# Altium schematic sheet 04_SiP_GND_NC.SchDoc
size 508 x 381 mm; SheetNumber: 4; SheetTotal: 16
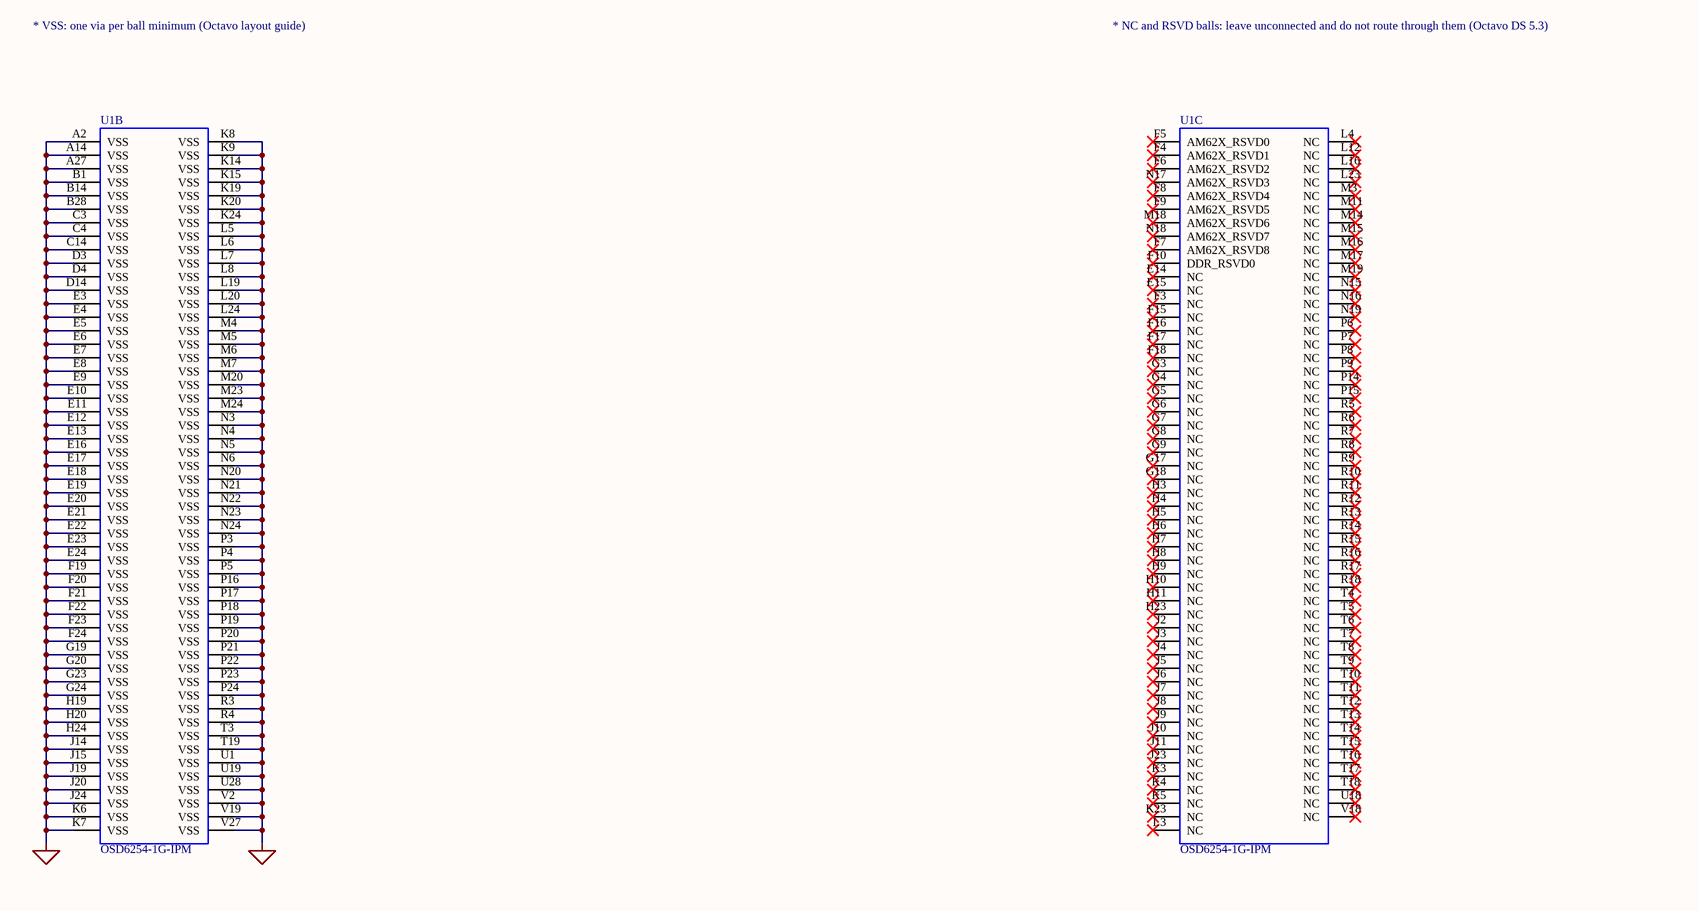
[diagram p0: 04_SiP_GND_NC.SchDoc]

## Parts
U1  OSD6254-1G-IPM  [OSD62X-PM_BGA500]  (parts B,C of 9)

## Nets
GND: U1.A2(VSS) U1.A14(VSS) U1.A27(VSS) U1.B1(VSS) U1.B14(VSS) U1.B28(VSS) U1.C3(VSS) U1.C4(VSS) U1.C14(VSS) U1.D3(VSS) U1.D4(VSS) U1.D14(VSS) U1.E3(VSS) U1.E4(VSS) U1.E5(VSS) U1.E6(VSS) U1.E7(VSS) U1.E8(VSS) U1.E9(VSS) U1.E10(VSS) U1.E11(VSS) U1.E12(VSS) U1.E13(VSS) U1.E16(VSS) U1.E17(VSS) U1.E18(VSS) U1.E19(VSS) U1.E20(VSS) U1.E21(VSS) U1.E22(VSS) U1.E23(VSS) U1.E24(VSS) U1.F19(VSS) U1.F20(VSS) U1.F21(VSS) U1.F22(VSS) U1.F23(VSS) U1.F24(VSS) U1.G19(VSS) U1.G20(VSS) U1.G23(VSS) U1.G24(VSS) U1.H19(VSS) U1.H20(VSS) U1.H24(VSS) U1.J14(VSS) U1.J15(VSS) U1.J19(VSS) U1.J20(VSS) U1.J24(VSS) U1.K6(VSS) U1.K7(VSS) U1.K8(VSS) U1.K9(VSS) U1.K14(VSS) U1.K15(VSS) U1.K19(VSS) U1.K20(VSS) U1.K24(VSS) U1.L5(VSS) U1.L6(VSS) U1.L7(VSS) U1.L8(VSS) U1.L19(VSS) U1.L20(VSS) U1.L24(VSS) U1.M4(VSS) U1.M5(VSS) U1.M6(VSS) U1.M7(VSS) U1.M20(VSS) U1.M23(VSS) U1.M24(VSS) U1.N3(VSS) U1.N4(VSS) U1.N5(VSS) U1.N6(VSS) U1.N20(VSS) U1.N21(VSS) U1.N22(VSS) U1.N23(VSS) U1.N24(VSS) U1.P3(VSS) U1.P4(VSS) U1.P5(VSS) U1.P16(VSS) U1.P17(VSS) U1.P18(VSS) U1.P19(VSS) U1.P20(VSS) U1.P21(VSS) U1.P22(VSS) U1.P23(VSS) U1.P24(VSS) U1.R3(VSS) U1.R4(VSS) U1.T3(VSS) U1.T19(VSS) U1.U1(VSS) U1.U19(VSS) U1.U28(VSS) U1.V2(VSS) U1.V19(VSS) U1.V27(VSS)

Not connected (* = marked no-connect by the designer): U1 E14(NC)* E15(NC)* F3(NC)* F4(AM62X_RSVD1)* F5(AM62X_RSVD0)* F6(AM62X_RSVD2)* F7(AM62X_RSVD8)* F8(AM62X_RSVD4)* F9(AM62X_RSVD5)* F10(DDR_RSVD0)* F15(NC)* F16(NC)* F17(NC)* F18(NC)* G3(NC)* G4(NC)* G5(NC)* G6(NC)* G7(NC)* G8(NC)* G9(NC)* G17(NC)* G18(NC)* H3(NC)* H4(NC)* H5(NC)* H6(NC)* H7(NC)* H8(NC)* H9(NC)* H10(NC)* H11(NC)* H23(NC)* J2(NC)* J3(NC)* J4(NC)* J5(NC)* J6(NC)* J7(NC)* J8(NC)* J9(NC)* J10(NC)* J11(NC)* J23(NC)* K3(NC)* K4(NC)* K5(NC)* K23(NC)* L3(NC)* L4(NC)* L12(NC)* L16(NC)* L23(NC)* M3(NC)* M11(NC)* M14(NC)* M15(NC)* M16(NC)* M17(NC)* M18(AM62X_RSVD6)* M19(NC)* N15(NC)* N16(NC)* N17(AM62X_RSVD3)* N18(AM62X_RSVD7)* N19(NC)* P6(NC)* P7(NC)* P8(NC)* P9(NC)* P14(NC)* P15(NC)* R5(NC)* R6(NC)* R7(NC)* R8(NC)* R9(NC)* R10(NC)* R11(NC)* R12(NC)* R13(NC)* R14(NC)* R15(NC)* R16(NC)* R17(NC)* R18(NC)* T4(NC)* T5(NC)* T6(NC)* T7(NC)* T8(NC)* T9(NC)* T10(NC)* T11(NC)* T12(NC)* T13(NC)* T14(NC)* T15(NC)* T16(NC)* T17(NC)* T18(NC)* U18(NC)* V18(NC)*

## Notes on the sheet
- * VSS: one via per ball minimum (Octavo layout guide)
- * NC and RSVD balls: leave unconnected and do not route through them (Octavo DS 5.3)

## Library data of the parts
U1 = OSD6254-1G-IPM: Octavo OSD6254 SiP: TI AM6254 + 1 GB DDR4, 9x14 mm 500-ball 0.5 mm BGA